# Altium schematic sheet Teensy4.SchDoc
size Letter; SheetNumber: 3; SheetTotal: 15
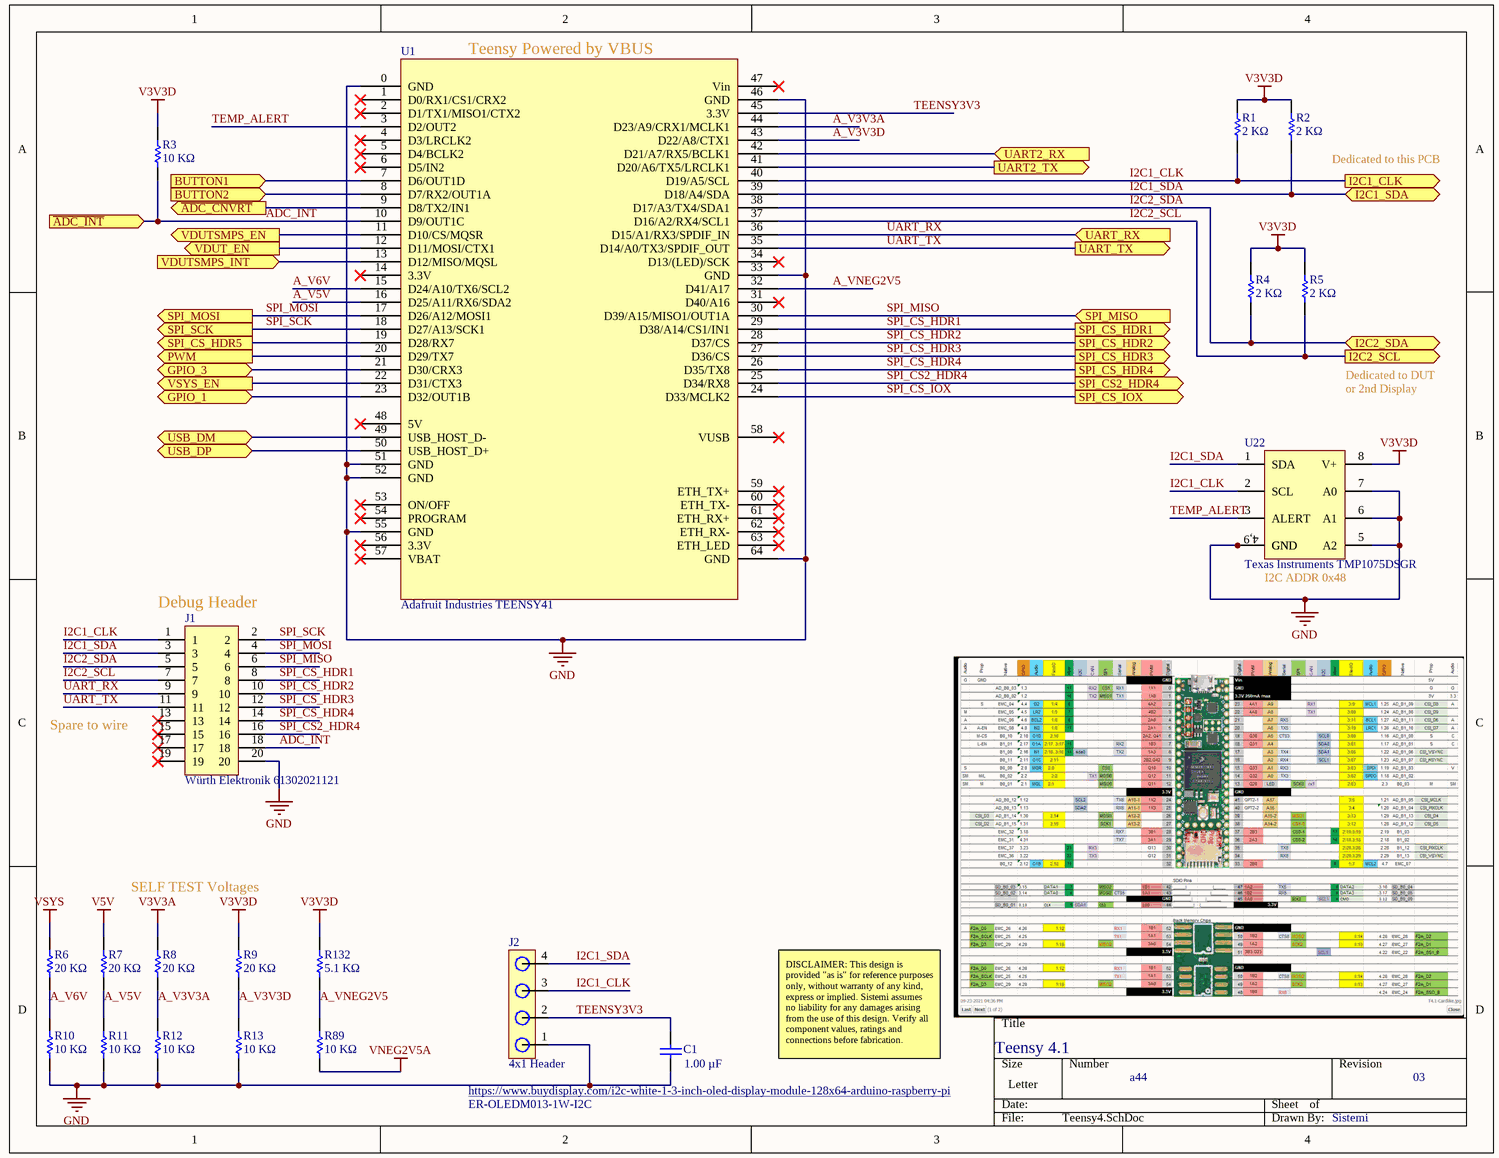
[diagram p0: Teensy4.SchDoc]

## Parts
C1  Capacitance: 1.00 µF  [CAPC1608X90X35NL15T15]  (hidden comment: Samsung CL10B105KA8NNNC)
J1  Würth Elektronik 61302021121  [PCB-nk6cd1c3p7lqby8wsdwb-1]
J2  4x1 Header  [PCB-frzzw7wnfsmgwg7mpl31-1]
R1  Resistance: 2 KΩ  [RESC1608X55X30ML15T15]  (hidden comment: Generic RES 0603)
R2  Resistance: 2 KΩ  [RESC1608X55X30ML15T15]  (hidden comment: Generic RES 0603)
R3  Resistance: 10 KΩ  [RESC1608X55X30ML15T15]  (hidden comment: Generic RES 0603)
R4  Resistance: 2 KΩ  [RESC1608X55X30ML15T15]  (hidden comment: Generic RES 0603)
R5  Resistance: 2 KΩ  [RESC1608X55X30ML15T15]  (hidden comment: Generic RES 0603)
R6  Resistance: 20 KΩ  [RESC1608X55X30ML15T15]  (hidden comment: Generic RES 0603)
R7  Resistance: 20 KΩ  [RESC1608X55X30ML15T15]  (hidden comment: Generic RES 0603)
R8  Resistance: 20 KΩ  [RESC1608X55X30ML15T15]  (hidden comment: Generic RES 0603)
R9  Resistance: 20 KΩ  [RESC1608X55X30ML15T15]  (hidden comment: Generic RES 0603)
R10  Resistance: 10 KΩ  [RESC1608X55X30ML15T15]  (hidden comment: Generic RES 0603)
R11  Resistance: 10 KΩ  [RESC1608X55X30ML15T15]  (hidden comment: Generic RES 0603)
R12  Resistance: 10 KΩ  [RESC1608X55X30ML15T15]  (hidden comment: Generic RES 0603)
R13  Resistance: 10 KΩ  [RESC1608X55X30ML15T15]  (hidden comment: Generic RES 0603)
R89  Resistance: 10 KΩ  [RESC1608X55X30ML15T15]  (hidden comment: Generic RES 0603)
R132  Resistance: 5.1 KΩ  [RESC1608X55X30ML15T15]  (hidden comment: Generic RES 0603)
U1  Adafruit Industries TEENSY41  [Adafruit Industries TEENSY41-Footprint-1]
U22  Texas Instruments TMP1075DSGR  [PCB-22psa42mhiow8cw0mt2a-1]

## Ports
BUTTON1 (in), BUTTON2 (in), GPIO_1 (bidir), GPIO_3 (bidir), I2C1_CLK (out), I2C1_SDA (bidir), I2C2_SCL (out), I2C2_SDA (bidir), PWM (out), SPI_CS2_HDR4 (out), SPI_CS_HDR1 (out), SPI_CS_HDR2 (out), SPI_CS_HDR3 (out), SPI_CS_HDR4 (out), SPI_CS_HDR5 (out), SPI_CS_IOX (out), SPI_MISO (in), SPI_MOSI (out), SPI_SCK (out), UART2_RX (in), UART2_TX (out), UART_RX (in), UART_TX (out), USB_DM (bidir), USB_DP (bidir), VDUT_EN (out), VDUTSMPS_EN (out), VDUTSMPS_INT (in), VSYS_EN (out), ~{ADC_CNVRT} (out), ~{ADC_INT} (in)

## Nets
GND: C1.1 J1.20 J2.1 R10.1 R11.1 R12.1 R13.1 U1.0(GND) U1.33(GND) U1.46(GND) U1.51(GND) U1.52(GND) U1.55(GND) U1.64(GND) U22.4(GND) U22.5(A2) U22.6(A1) U22.7(A0) U22.9(GND)
V3V3A: R8.2
V3V3D: R1.2 R2.2 R3.1 R4.2 R5.2 R9.2 R132.2 U22.8(V+)
V5V: R7.2
VNEG2V5A: R89.1
VSYS: R6.2
~{ADC_CNVRT}: U1.9(D8/TX2/IN1) ; port ~{ADC_CNVRT}
A_V3V3A: R8.1 R12.2 U1.44(D23/A9/CRX1/MCLK1)
A_V3V3D: R9.1 R13.2 U1.43(D22/A8/CTX1)
A_V5V: R7.1 R11.2 U1.16(D25/A11/RX6/SDA2)
A_V6V: R6.1 R10.2 U1.15(D24/A10/TX6/SCL2)
A_VNEG2V5: R89.2 R132.1 U1.32(D41/A17)
ADC_INT: J1.18 R3.2 U1.10(D9/OUT1C) ; port ~{ADC_INT}
BUTTON1: U1.7(D6/OUT1D) ; port BUTTON1
BUTTON2: U1.8(D7/RX2/OUT1A) ; port BUTTON2
GPIO_1: U1.23(D32/OUT1B) ; port GPIO_1
GPIO_3: U1.21(D30/CRX3) ; port GPIO_3
I2C1_CLK: J1.1 J2.3 R1.1 U1.40(D19/A5/SCL) U22.2(SCL) ; port I2C1_CLK
I2C1_SDA: J1.3 J2.4 R2.1 U1.39(D18/A4/SDA) U22.1(SDA) ; port I2C1_SDA
I2C2_SCL: J1.7 R5.1 U1.37(D16/A2/RX4/SCL1) ; port I2C2_SCL
I2C2_SDA: J1.5 R4.1 U1.38(D17/A3/TX4/SDA1) ; port I2C2_SDA
PWM: U1.20(D29/TX7) ; port PWM
SPI_CS2_HDR4: J1.16 U1.25(D34/RX8) ; port SPI_CS2_HDR4
SPI_CS_HDR1: J1.8 U1.29(D38/A14/CS1/IN1) ; port SPI_CS_HDR1
SPI_CS_HDR2: J1.10 U1.28(D37/CS) ; port SPI_CS_HDR2
SPI_CS_HDR3: J1.12 U1.27(D36/CS) ; port SPI_CS_HDR3
SPI_CS_HDR4: J1.14 U1.26(D35/TX8) ; port SPI_CS_HDR4
SPI_CS_HDR5: U1.19(D28/RX7) ; port SPI_CS_HDR5
SPI_CS_IOX: U1.24(D33/MCLK2) ; port SPI_CS_IOX
SPI_MISO: J1.6 U1.30(D39/A15/MISO1/OUT1A) ; port SPI_MISO
SPI_MOSI: J1.4 U1.17(D26/A12/MOSI1) ; port SPI_MOSI
SPI_SCK: J1.2 U1.18(D27/A13/SCK1) ; port SPI_SCK
TEENSY3V3: C1.2 J2.2 U1.45(3.3V)
TEMP_ALERT: U1.3(D2/OUT2) U22.3(ALERT)
UART2_RX: U1.42(D21/A7/RX5/BCLK1) ; port UART2_RX
UART2_TX: U1.41(D20/A6/TX5/LRCLK1) ; port UART2_TX
UART_RX: J1.9 U1.36(D15/A1/RX3/SPDIF_IN) ; port UART_RX
UART_TX: J1.11 U1.35(D14/A0/TX3/SPDIF_OUT) ; port UART_TX
USB_DM: U1.49(USB_HOST_D-) ; port USB_DM
USB_DP: U1.50(USB_HOST_D+) ; port USB_DP
VDUT_EN: U1.12(D11/MOSI/CTX1) ; port VDUT_EN
VDUTSMPS_EN: U1.11(D10/CS/MQSR) ; port VDUTSMPS_EN
VDUTSMPS_INT: U1.13(D12/MISO/MQSL) ; port VDUTSMPS_INT
VSYS_EN: U1.22(D31/CTX3) ; port VSYS_EN

Not connected (* = marked no-connect by the designer): J1 13* 15* 17* 19*; U1 1(D0/RX1/CS1/CRX2)* 2(D1/TX1/MISO1/CTX2)* 4(D3/LRCLK2)* 5(D4/BCLK2)* 6(D5/IN2)* 14(3.3V)* 31(D40/A16)* 34(D13/(LED)/SCK)* 47(Vin)* 48(5V)* 53(ON/OFF)* 54(PROGRAM)* 56(3.3V)* 57(VBAT)* 58(VUSB)* 59(ETH_TX+)* 60(ETH_TX-)* 61(ETH_RX+)* 62(ETH_RX-)* 63(ETH_LED)*

## Notes on the sheet
- (near U1) Teensy Powered by VBUS
- (near R2) Dedicated to this PCB
- Dedicated to DUT
- or 2nd Display
- (near J1) Debug Header
- (near U22) I2C ADDR 0x48
- (near J1) Spare to wire
- SELF TEST Voltages
- https://www.buydisplay.com/i2c-white-1-3-inch-oled-display-module-128x64-arduino-raspberry-pi
- ER-OLEDM013-1W-I2C
- DISCLAIMER: This design is provided "as is" for reference purposes only, without warranty of any kind, express or implied. Sistemi assumes no liability for any damages arising from the use of this design. Verify all component values, ratings and connections before fabrication.
- Teensy 4.1
- a44
- 03
- Sistemi
- (in symbol CMP-0b87c75f2930d440-2) 4,9

## Library data of the parts
C1 = CMP-7473528-5: CL Series 0603 1 uF 25 V ±10 % X7R Surface Mount Multilayer Ceramic Capacitor; Manufacturer Part Number: UMK107AB7105KA-T; Lead-Free Status: Lead Free; Capacitance Tolerance: ±10%; Voltage Rating (DC): 25.0 V; RoHS: Compliant; Mounting Style: Surface Mount; Footprint: PCB-0002-00062-3; Octopart URL: http://octopart.com/cl10b105ka8nnnc-samsung-19831597; Case/Package: 0603; OctopartID: ce7a065e703111bd; Dielectric Characteristic: X7R
J1 = CMP-005cc8a3733edf9b-7: THT Vertical Pin Header WR-PHD, Pitch 2.54 mm, Dual Row, 20 pins; Current Rating: 3.00 A; Dielectric Withstanding Voltage: 500 V; Pin Pitch: 2.54 mm; Operating Voltage: 250 V; Number of Contacts: 20; Contact Resistance: 20.0 mΩ; Gender: Male; Contact Material: Copper; Footprint: PCB-005cc8a3733edf9b-1; Mounting Style: Through Hole; Color: Black; Contact Plating: Gold; REACH SVHC Compliance: No SVHC; RoHS: Compliant; Octopart URL: https://octopart.com/61302021121-w%C3%BCrth+elektronik-32855556; Packaging: Bag; Orientation: Vertical; OctopartID: 005cc8a3733edf9b; Number of Pins: 20; Operating Temperature: -40.0 °C (min); Manufacturer Part Number: 61302021121
J2 = CMP-2ffce6f22d89f03b-6: 2.54mm 100mil header; Manufacturer Part Number: TSW-102-07-G-D; Number of Positions: 4; Gender: Male; Lead-Free Status: Lead Free; OctopartID: 2ffce6f22d89f03b; Pin Pitch: 2.54 mm; REACH SVHC Compliance: No SVHC; Packaging: Bulk; Color: Black; Octopart URL: https://octopart.com/tsw-102-07-g-d-samtec-272147; Contact Plating: Gold; Size-Width: 5.08 mm; Mounting Style: Through Hole; Size-Height: 2.54 mm; Housing Color: Black; Size-Length: 5.08 mm; Operating Temperature: 125 °C (max); Number of Contacts: 4; Housing Material: Plastic; RoHS: Compliant; Contact Material: Phosphor Bronze; Number of Rows: 2
R1 R2 R4 R5 = CMP-0800c38b3cf2d7c7-3: Generic RES 0603, =Resistance+','+Tolerance+','+Case; Manufacturer Part Number: RE0603FRE072KL; Case/Package (SI): 1608; Lead-Free Status: Lead Free; Power Rating: 63.0 mW; Voltage: 50V; ELV Compliant: Compliant; Tolerance: ±1%; Temperature Coefficient: -50.0 ppm/°C to 50.0 ppm/°C; Octopart URL: TBD; Number of Pins: 2; Mounting Style: Surface Mount; Packaging: Tape & Reel (TR); Lifecycle Status: Active; RoHS: Compliant; Case: 0603; Operating Temperature: -55.0 °C to 125 °C; REACH SVHC Compliance: No SVHC; Footprint: PCB-0002-00066-3; OctopartID: a8e96364fc37772e
R3 R10-R13 R89 = CMP-0800c38b3cf2d7c7-3: Generic RES 0603, =Resistance+','+Tolerance+','+Case; Manufacturer Part Number: MCT06030C1002FP500; Case/Package (SI): 1608; Lead-Free Status: Lead Free; Power Rating: 63.0 mW; Voltage: 50V; ELV Compliant: Compliant; Tolerance: ±1%; Temperature Coefficient: -50.0 ppm/°C to 50.0 ppm/°C; Octopart URL: TBD; Number of Pins: 2; Mounting Style: Surface Mount; Packaging: Tape & Reel (TR); Lifecycle Status: Active; RoHS: Compliant; Case: 0603; Operating Temperature: -55.0 °C to 125 °C; REACH SVHC Compliance: No SVHC; Footprint: PCB-0002-00066-3; OctopartID: a8e96364fc37772e
R6-R9 = CMP-0800c38b3cf2d7c7-3: Generic RES 0603, =Resistance+','+Tolerance+','+Case; Manufacturer Part Number: RT0603FRE1320KL; Case/Package (SI): 1608; Lead-Free Status: Lead Free; Power Rating: 63.0 mW; Voltage: 50V; ELV Compliant: Compliant; Tolerance: ±1%; Temperature Coefficient: -50.0 ppm/°C to 50.0 ppm/°C; Octopart URL: TBD; Number of Pins: 2; Mounting Style: Surface Mount; Packaging: Tape & Reel (TR); Lifecycle Status: Active; RoHS: Compliant; Case: 0603; Operating Temperature: -55.0 °C to 125 °C; REACH SVHC Compliance: No SVHC; Footprint: PCB-0002-00066-3; OctopartID: a8e96364fc37772e
R132 = CMP-0800c38b3cf2d7c7-3: Generic RES 0603, =Resistance+','+Tolerance+','+Case; Manufacturer Part Number: RT0603FRE075K1L; Case/Package (SI): 1608; Lead-Free Status: Lead Free; Power Rating: 63.0 mW; Voltage: 50V; ELV Compliant: Compliant; Tolerance: ±1%; Temperature Coefficient: -50.0 ppm/°C to 50.0 ppm/°C; Octopart URL: TBD; Number of Pins: 2; Mounting Style: Surface Mount; Packaging: Tape & Reel (TR); Lifecycle Status: Active; RoHS: Compliant; Case: 0603; Operating Temperature: -55.0 °C to 125 °C; REACH SVHC Compliance: No SVHC; Footprint: PCB-0002-00066-3; OctopartID: a8e96364fc37772e
U1 = CMP-9ae65445f7a64521-2: PJRC Teensy 4.1 Development Board; OctopartID: 9ae65445f7a64521; Manufacturer Part Number: TEENSY41; Octopart Url: https://octopart.com/teensy41-adafruit+industries-128534566
U22 = CMP-0b87c75f2930d440-2: High-accuracy upgrade to industry standard LM75 / TMP75 I2C temperature sensor 8-WSON -55 to 125; Case/Package: WSON; RoHS: Compliant; Octopart URL: https://octopart.com/tmp1075dsgr-texas+instruments-97650641; Lifecycle Status: Pre-Release; Manufacturer Part Number: TMP1075DSGR; OctopartID: 0b87c75f2930d440; Number of Pins: 8